# Altium schematic sheet 0_BLOCK_DIAGRAM.SchDoc
size Tabloid; SheetNumber: 1; SheetTotal: 6
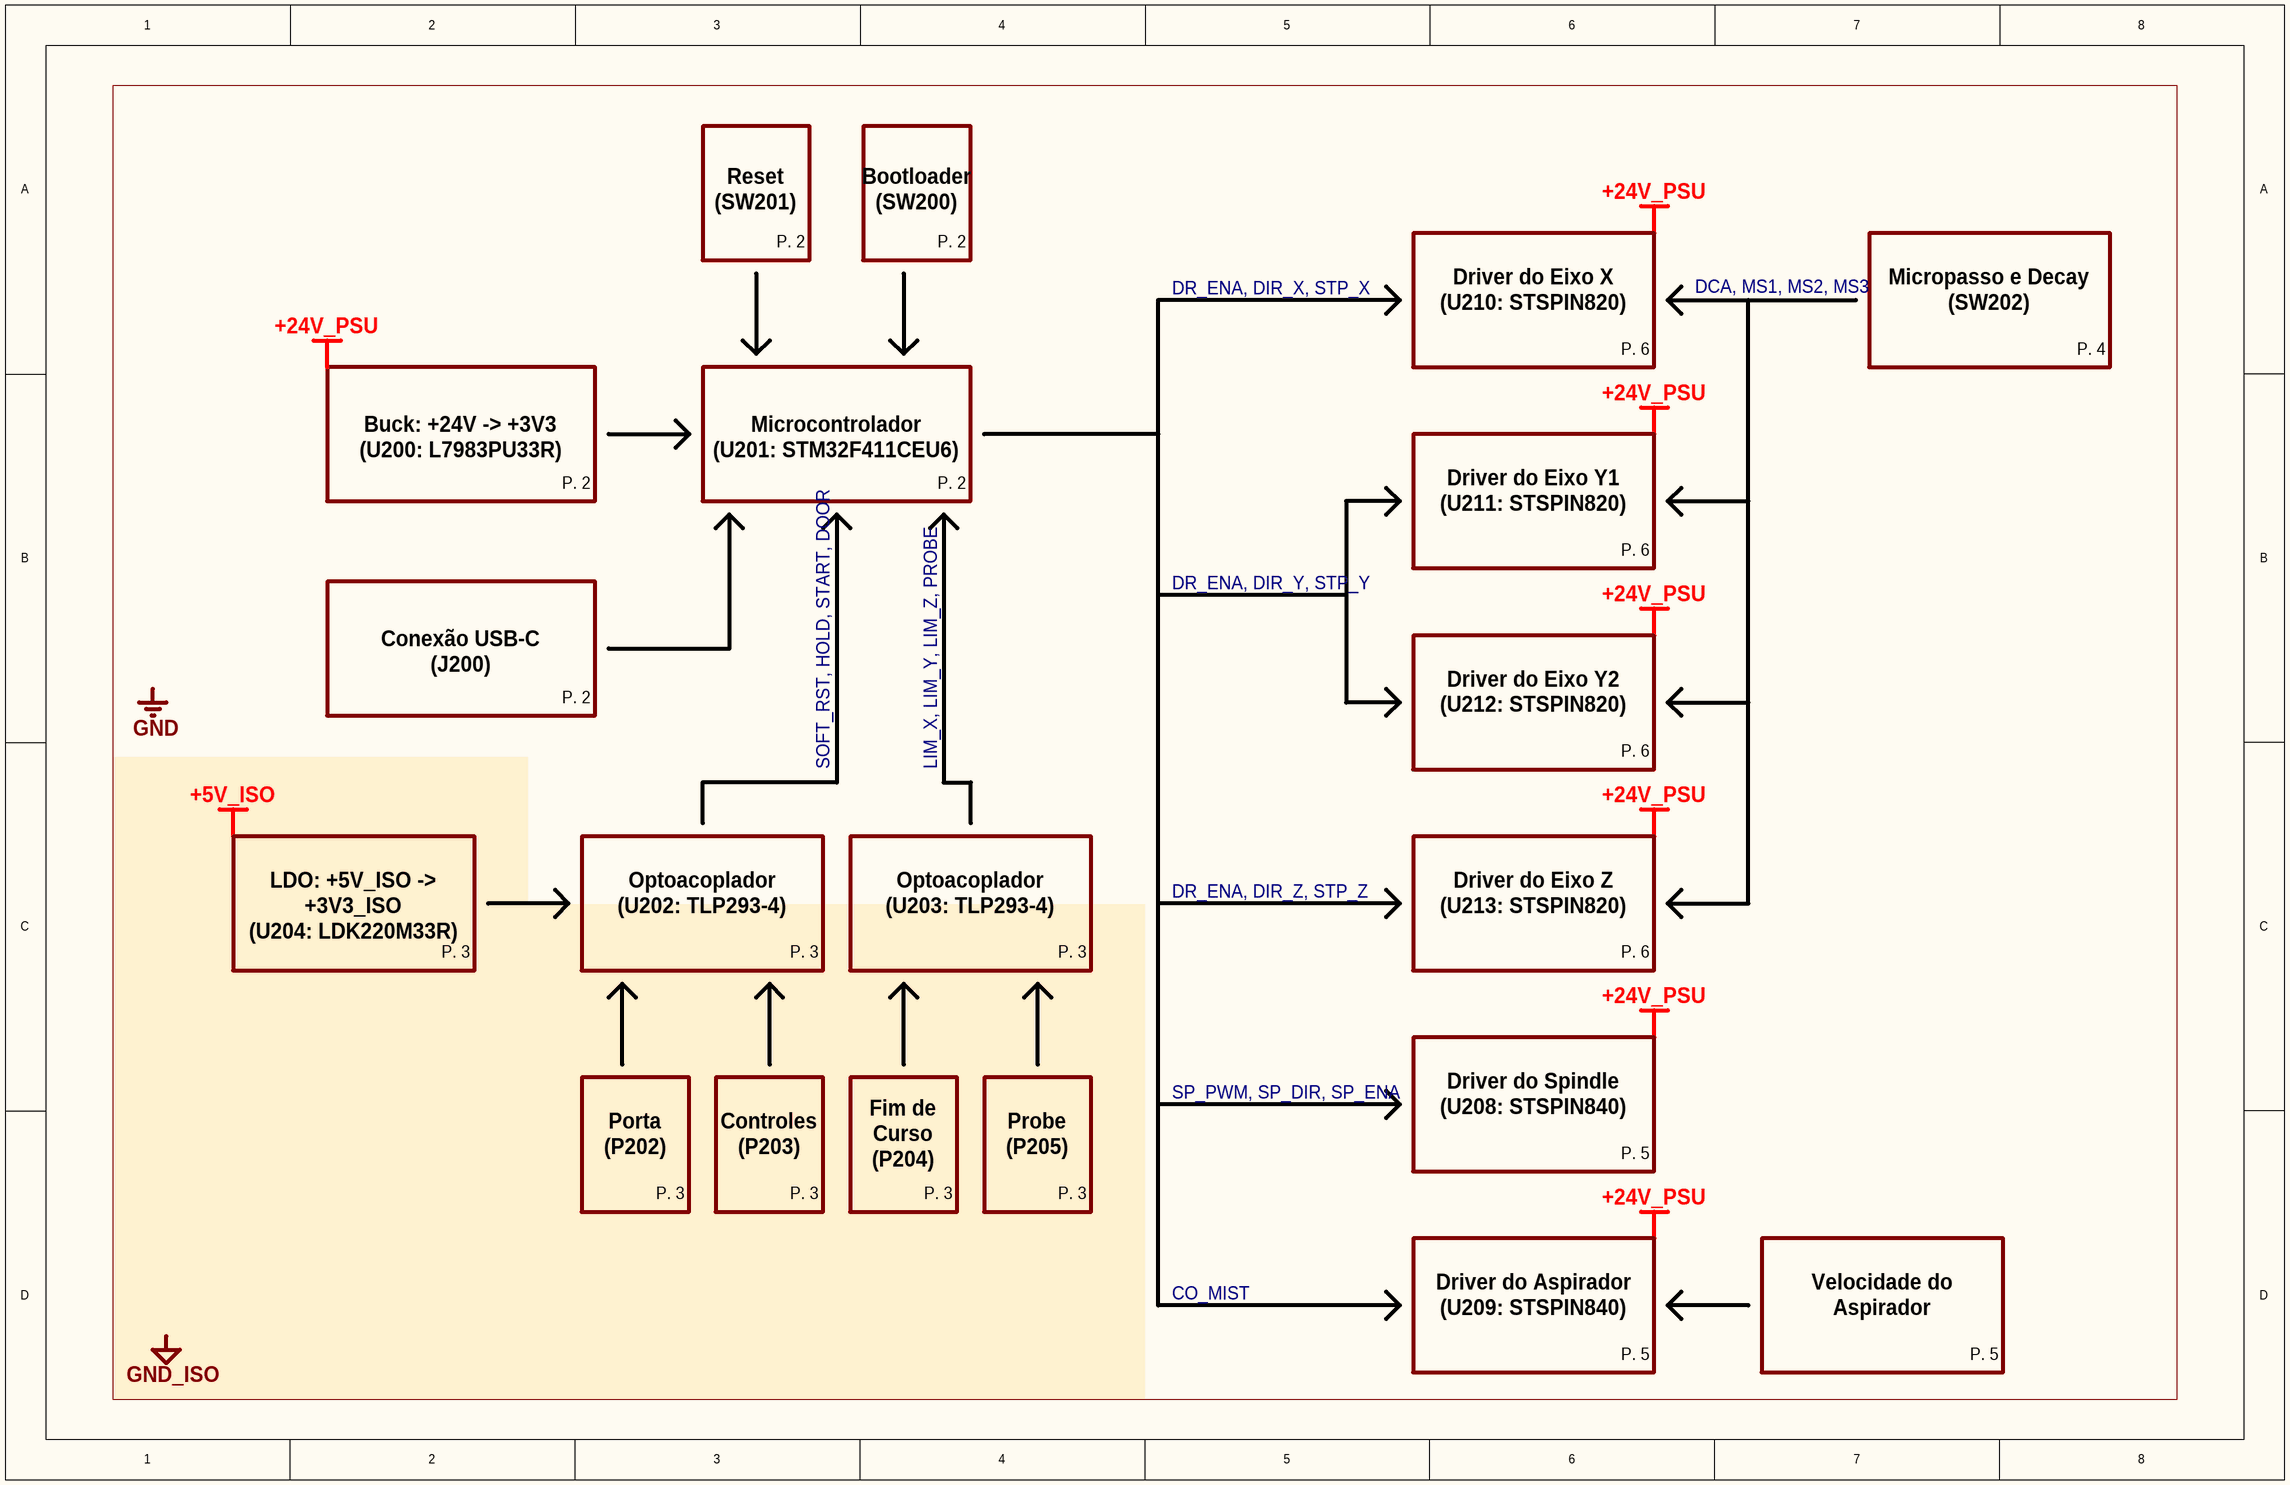
[diagram p0: 0_BLOCK_DIAGRAM.SchDoc]

## Notes on the sheet
- Reset
  (SW201)
- Bootloader
  (SW200)
- +24V_PSU
- P. 2
- DR_ENA, DIR_X, STP_X
- DCA, MS1, MS2, MS3
- Driver do Eixo X
  (U210: STSPIN820)
- P. 6
- Micropasso e Decay
  (SW202)
- P. 4
- Buck: +24V -> +3V3
  (U200: L7983PU33R)
- Microcontrolador
  (U201: STM32F411CEU6)
- Driver do Eixo Y1
  (U211: STSPIN820)
- DR_ENA, DIR_Y, STP_Y
- Conexão USB-C
  (J200)
- GND
- SOFT_RST, HOLD, START, DOOR
- LIM_X, LIM_Y, LIM_Z, PROBE
- Driver do Eixo Y2
  (U212: STSPIN820)
- +5V_ISO
- DR_ENA, DIR_Z, STP_Z
- LDO: +5V_ISO -> +3V3_ISO
  (U204: LDK220M33R)
- P. 3
- Optoacoplador
  (U202: TLP293-4)
- Optoacoplador
  (U203: TLP293-4)
- Driver do Eixo Z
  (U213: STSPIN820)
- SP_PWM, SP_DIR, SP_ENA
- Fim de Curso
  (P204)
- Driver do Spindle
  (U208: STSPIN840)
- P. 5
- Porta
  (P202)
- Controles
  (P203)
- Probe
  (P205)
- CO_MIST
- Driver do Aspirador
  (U209: STSPIN840)
- Velocidade do Aspirador
  (R262)
- GND_ISO
- Title:
- Size:
- Tabloid
- Number:
- Sheet of:
- Revision:
- Date:
- Project Name:
- Drawn By: